# Altium schematic sheet 02_PHY_Automotive.SchDoc (part 2 of 2)
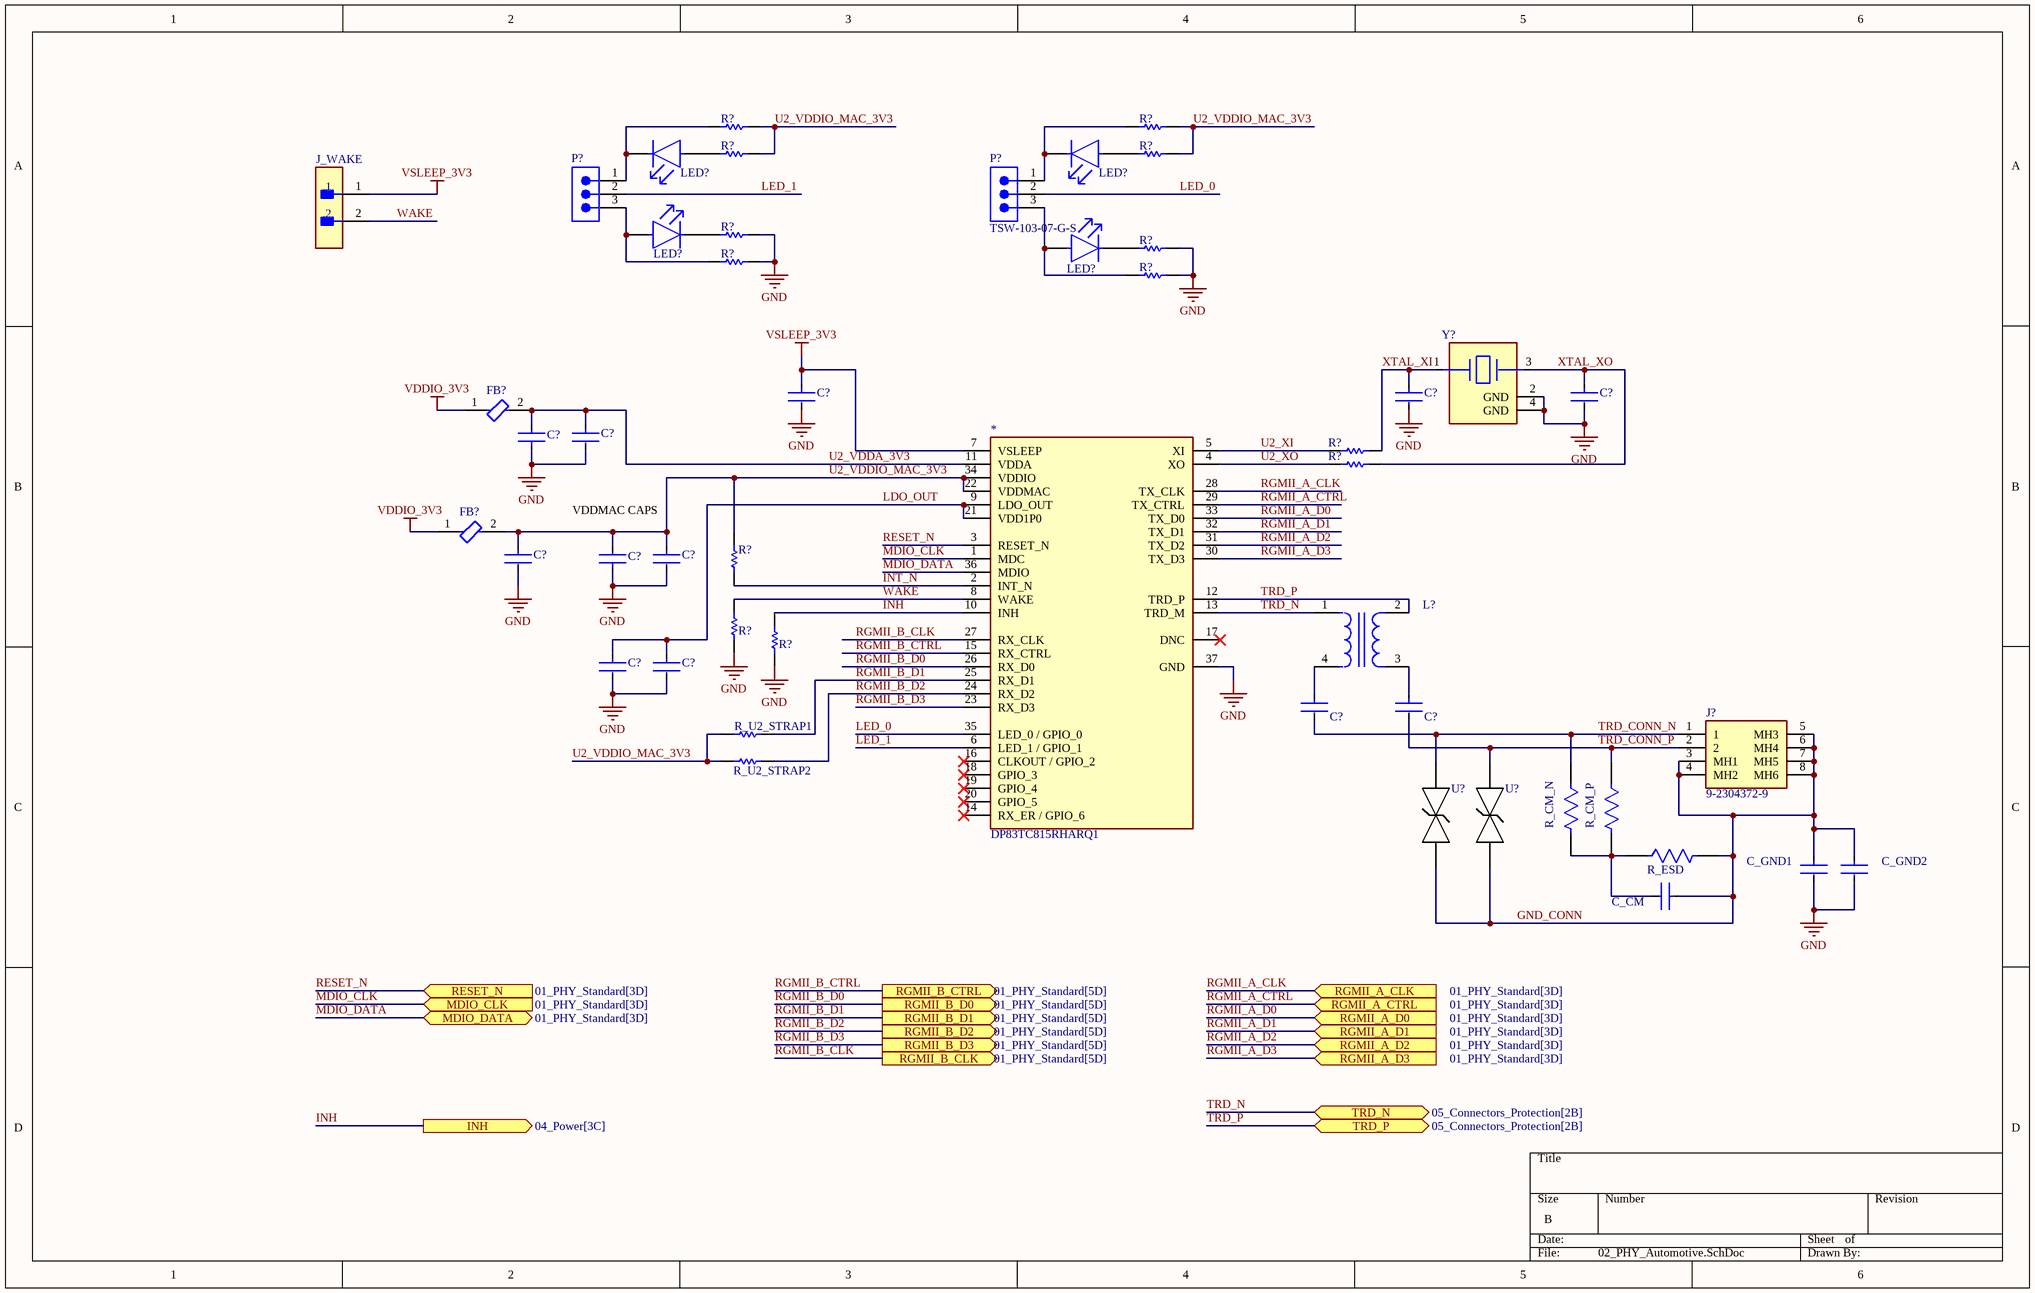
[diagram p1: 02_PHY_Automotive.SchDoc]

## Library data of the parts
* = DP83TC815RHARQ1: Automotive 100Base-T1 Ethernet PHY with RGMII, SGMII and 802.1AS 36-VQFN -40 to 125; Manufacturer: Texas Instruments; Manufacturer Lifecycle Status: ACTIVE; Supplier: Mouser; Supplier Part Number: 595-DP83TC815RHARQ1; Manufacturer Part Number: DP83TC815RHARQ1; RoHS: Compliant; Category: Ethernet Controller; Stock: 627; Pricing: 1=3.97, 10=2.97, 50=2.72, 100=2.45, 1000=2.22, 10000=2.04 (USD); Case/Package: VQFN; Height: 1mm; Interface: RGMII, SGMII; Length: 6mm; Lifecycle Status: Production; Pins: 36; Thickness: 900µm; Width: 6mm; ComponentLink1URL: https://sigma.octopart.com:443/158979647/technical_drawing/Texas-Instruments-DP83TC815RHARQ1.pdf?src-supplier=Texas+Instruments; ComponentLink1Description: https://sigma.octopart.com:443/158979647/technical_drawing/Texas-Instruments-DP83TC815RHARQ1.pdf?src-supplier=Texas+Instruments; ComponentLink2URL: https://octopart.com:443/opatz8j6/c1?t=WeX0H2-6bUulIsG1Jt8hv3i0-DNF6EgtsYe5-0_d1TbLVM-qdl5AsRgmevogmcbsfVOmMxpULns-nvNEE9aIzANogtbU3GBMtZtI8fq6qckBovz9G97i9WrpuxlHuKs9BYn-6D1DANaFcY_qGIZJX9mEtaxsXjueSlrVl1iWUQxH2Bp2NDMtZlTzGpTWBiW7CpwP9V_eJlIy0vZBhrVCBBDA9JUIoAatkLwt8PzT_-9KrI00vijdvUEBTwRYjYCWzSz7DYr9IG1HssyswWTHqsAcyBRv6N7hVVMQZcnxqSqDhzf9RBMys264Gnq-bQZT3orF0xxyRFJYuY-UOMz_xm9QsZyD7JISTUueKHJNrPt3yQi5glmwWHqc71mltjYsTyFmv_ZjbIWrYzA&src-supplier=Texas+Instruments; ComponentLink2Description: https://octopart.com:443/opatz8j6/c1?t=WeX0H2-6bUulIsG1Jt8hv3i0-DNF6EgtsYe5-0_d1TbLVM-qdl5AsRgmevogmcbsfVOmMxpULns-nvNEE9aIzANogtbU3GBMtZtI8fq6qckBovz9G97i9WrpuxlHuKs9BYn-6D1DANaFcY_qGIZJX9mEtaxsXjueSlrVl1iWUQxH2Bp2NDMtZlTzGpTWBiW7CpwP9V_eJlIy0vZBhrVCBBDA9JUIoAatkLwt8PzT_-9KrI00vijdvUEBTwRYjYCWzSz7DYr9IG1HssyswWTHqsAcyBRv6N7hVVMQZcnxqSqDhzf9RBMys264Gnq-bQZT3orF0xxyRFJYuY-UOMz_xm9QsZyD7JISTUueKHJNrPt3yQi5glmwWHqc71mltjYsTyFmv_ZjbIWrYzA&src-supplier=Texas+Instruments; ComponentLink3URL: http://sigma.octopart.com:80/reach_statement/Texas-Instruments-company-64.pdf?src-supplier=Compliance+Statements; ComponentLink3Description: http://sigma.octopart.com:80/reach_statement/Texas-Instruments-company-64.pdf?src-supplier=Compliance+Statements; ComponentLink4URL: http://sigma.octopart.com:80/conflict_mineral_statement/Texas-Instruments-company-63.pdf?src-supplier=Compliance+Statements; ComponentLink4Description: http://sigma.octopart.com:80/conflict_mineral_statement/Texas-Instruments-company-63.pdf?src-supplier=Compliance+Statements
C?#1 C?#10 = CMP-06035-054249-1: Cap Ceramic Multilayer Automotive 0.1uF ±0.1 16VDC X7R 15% 0402 (1005M); Capacitance: 100nF; Tolerance: 10%; Voltage Rating (DC): 16V; Lead Free: Lead Free; Dielectric: X7R
C?#2 C?#3 = CMP-03422-001135-1: Multilayer Ceramic Capacitors Mlcc - Smd/Smt 50V 22Pf C0G 0402 5% Aec-Q200; Manufacturer: Yageo Group; Supplier: Avnet; Supplier Part Number: C0402C220J5GACAUTO; Manufacturer Part Number: C0402C220J5GACAUTO; RoHS: Compliant; Category: Ceramic Capacitors; Stock: 20077; Pricing: 1=0.112, 25=0.046, 100=0.029, 250=0.026, 500=0.023, 1000=0.02, 2500=0.018 (USD); Value: 22pF; Case/Package: 0402; Case Code (Imperial): 0402; Case Code (Metric): 1005; China RoHS: Compliant; Depth: 500µm; Dielectric: C0G; Dielectric Material: Ceramic; Height: 500µm; Lead Free: Lead Free; Length: 1mm; Lifecycle Status: Production; Material: Ceramic; Max Operating Temperature: 125°C; Min Operating Temperature: -55°C; Mounting Technology: Surface Mount; Pins: 2; Number of Terminals: 2; Ratings: AEC-Q200; REACH SVHC: Unaffected; Schedule B: 8532240020, 8532240020|8532240020, 8532240020|8532240020|8532240020, 8532240020|8532240020|8532240020|8532240020; Thickness: 558.8µm; Tolerance: 5%; Voltage Rating: 50V; Voltage Rating (DC): 50V; Width: 500µm; ComponentLink1URL: https://datasheet.octopart.com:443/C0402C220J5GACAUTO-KEMET-datasheet-178087916.pdf?src-supplier=IHS; ComponentLink1Description: https://datasheet.octopart.com:443/C0402C220J5GACAUTO-KEMET-datasheet-178087916.pdf?src-supplier=IHS; ComponentLink2URL: https://datasheet.octopart.com:443/C0402C220J5GACAUTO-KEMET-datasheet-137357759.pdf?src-supplier=Upverter; ComponentLink2Description: https://datasheet.octopart.com:443/C0402C220J5GACAUTO-KEMET-datasheet-137357759.pdf?src-supplier=Upverter; ComponentLink3URL: https://datasheet.octopart.com:443/C0402C220J5GACAUTO-KEMET-datasheet-137357764.pdf?src-supplier=element14+APAC; ComponentLink3Description: https://datasheet.octopart.com:443/C0402C220J5GACAUTO-KEMET-datasheet-137357764.pdf?src-supplier=element14+APAC; ComponentLink4URL: https://datasheet.octopart.com:443/C0402C220J5GACAUTO-KEMET-datasheet-83968781.pdf?src-supplier=element14+APAC; ComponentLink4Description: https://datasheet.octopart.com:443/C0402C220J5GACAUTO-KEMET-datasheet-83968781.pdf?src-supplier=element14+APAC; ComponentLink5URL: https://datasheet.octopart.com:443/C0402C220J5GACAUTO-Kemet-datasheet-66076621.pdf?src-supplier=element14+APAC; ComponentLink5Description: https://datasheet.octopart.com:443/C0402C220J5GACAUTO-Kemet-datasheet-66076621.pdf?src-supplier=element14+APAC; ComponentLink6URL: https://datasheet.octopart.com:443/C0402C220J5GACAUTO-KEMET-datasheet-86448239.pdf?src-supplier=Farnell; ComponentLink6Description: https://datasheet.octopart.com:443/C0402C220J5GACAUTO-KEMET-datasheet-86448239.pdf?src-supplier=Farnell; ComponentLink7URL: https://datasheet.octopart.com:443/C0402C220J5GACAUTO-KEMET-datasheet-100087244.pdf?src-supplier=Farnell; ComponentLink7Description: https://datasheet.octopart.com:443/C0402C220J5GACAUTO-KEMET-datasheet-100087244.pdf?src-supplier=Farnell; ComponentLink8URL: https://datasheet.octopart.com:443/C0402C220J5GACAUTO-KEMET-datasheet-181956123.pdf?src-supplier=Farnell; ComponentLink8Description: https://datasheet.octopart.com:443/C0402C220J5GACAUTO-KEMET-datasheet-181956123.pdf?src-supplier=Farnell; ComponentLink9URL: https://datasheet.octopart.com:443/C0402C220J5GACAUTO-KEMET-datasheet-74831227.pdf?src-supplier=Newark; ComponentLink9Description: https://datasheet.octopart.com:443/C0402C220J5GACAUTO-KEMET-datasheet-74831227.pdf?src-supplier=Newark; ComponentLink10URL: https://datasheet.octopart.com:443/C0402C220J5GACAUTO-Kemet-datasheet-62069308.pdf?src-supplier=Newark; ComponentLink10Description: https://datasheet.octopart.com:443/C0402C220J5GACAUTO-Kemet-datasheet-62069308.pdf?src-supplier=Newark; ComponentLink11URL: https://datasheet.octopart.com:443/C0402C220J5GACAUTO-KEMET-datasheet-176334072.pdf?src-supplier=Newark; ComponentLink11Description: https://datasheet.octopart.com:443/C0402C220J5GACAUTO-KEMET-datasheet-176334072.pdf?src-supplier=Newark; ComponentLink12URL: https://datasheet.octopart.com:443/C0402C220J5GACAUTO-KEMET-datasheet-157246110.pdf?src-supplier=Electro+Sonic; ComponentLink12Description: https://datasheet.octopart.com:443/C0402C220J5GACAUTO-KEMET-datasheet-157246110.pdf?src-supplier=Electro+Sonic; ComponentLink13URL: https://datasheet.octopart.com:443/C0402C220J5GACAUTO-KEMET-datasheet-188512012.pdf?src-supplier=ODG+(Origin+Data+Global); ComponentLink13Description: https://datasheet.octopart.com:443/C0402C220J5GACAUTO-KEMET-datasheet-188512012.pdf?src-supplier=ODG+(Origin+Data+Global); ComponentLink14URL: https://datasheet.octopart.com:443/C0402C220J5GACAUTO-KEMET-datasheet-140803224.pdf?src-supplier=TME; ComponentLink14Description: https://datasheet.octopart.com:443/C0402C220J5GACAUTO-KEMET-datasheet-140803224.pdf?src-supplier=TME; ComponentLink15URL: https://datasheet.octopart.com/C0402C220J5GACAUTO-KEMET-datasheet-84169754.pdf; ComponentLink15Description: https://datasheet.octopart.com/C0402C220J5GACAUTO-KEMET-datasheet-84169754.pdf; ComponentLink16URL: http://sigma.octopart.com:80/conflict_mineral_statement/Yageo-company-3.pdf?src-supplier=Compliance+Statements; ComponentLink16Description: http://sigma.octopart.com:80/conflict_mineral_statement/Yageo-company-3.pdf?src-supplier=Compliance+Statements; ComponentLink17URL: http://sigma.octopart.com:80/rohs_statement/Yageo-company-2.pdf?src-supplier=Compliance+Statements; ComponentLink17Description: http://sigma.octopart.com:80/rohs_statement/Yageo-company-2.pdf?src-supplier=Compliance+Statements
C?#4 C?#6 C?#7 = CMP-03422-001135-1: CAP CER 10000PF 16V X7R 0402; Manufacturer: Yageo; Value: 10 nF; Automotive Grade: Grade 1; Temperature Coefficient: ±15%; Tolerance: 0.1; Material: Ceramic; Octopart: https://octopart.com/ac0402krx7r7bb103-yageo-76900920; Height: 0.55mm; Footprint Url: http://www.yageo.com/exep/pages/download/literatures/UPY-C_GEN_24.pdf; Lead Free: Yes; RoHS: TRUE; Digikey Description: CAP CER 10000PF 16V X7R 0402; Temperature Range Low: -55°C; Device Class L1: Passive Components; Voltage Rating: 16 V; Temperature: -55°C to +125°C; Capacitance: 10 nF; Package: AC0402-0.5; ComponentLink2Description: Datasheet; Device Class L3: Ceramic Capacitors; Temperature Range High: +125°C; Ipc Land Pattern Name: CAPC10050X50; Device Class L2: Capacitors; Temperature Characteristic: X7R; Category: Cap; ComponentLink2URL: http://www.yageo.com/documents/recent/UPY-AC_NP0X7R_16V-to-630V_12.pdf; Manufacturer Part Number: AC0402KRX7R7BB103; Automotive: Yes
C?#5 C?#8 = CMP-03020-024138-1: 16V 470nF X7R ±10% 0603 Multilayer Ceramic Capacitors MLCC - SMD/SMT ROHS; Manufacturer: Yageo Group; Supplier: Mouser; Supplier Part Number: 603-AC0603KRX77BB474; Manufacturer Part Number: AC0603KRX7R7BB474; RoHS: Compliant; Category: Ceramic Capacitors; Stock: 329; Pricing: 1=0.33, 10=0.193, 50=0.136, 100=0.118, 1000=0.089, 10000=0.041 (USD); Value: 470nF; Case/Package: 0603; China RoHS: Compliant; Dielectric: X7R; Dielectric Material: Ceramic; Height: 800µm; Length: 1.6mm; Lifecycle Status: Production; Material: Ceramic; Max Operating Temperature: 125°C; Min Operating Temperature: -55°C; Mounting Technology: Surface Mount; Number of Terminals: 2; Ratings: AEC-Q200; REACH SVHC: Unaffected; Tolerance: 10%; Voltage Rating: 16V; Voltage Rating (DC): 16V; Width: 800µm; ComponentLink1URL: https://datasheet.octopart.com:443/AC0603KRX7R7BB474-Yageo-datasheet-170333968.pdf?src-supplier=IHS; ComponentLink1Description: https://datasheet.octopart.com:443/AC0603KRX7R7BB474-Yageo-datasheet-170333968.pdf?src-supplier=IHS; ComponentLink2URL: https://datasheet.octopart.com:443/AC0603KRX7R7BB474-Yageo-datasheet-130008987.pdf?src-supplier=Upverter; ComponentLink2Description: https://datasheet.octopart.com:443/AC0603KRX7R7BB474-Yageo-datasheet-130008987.pdf?src-supplier=Upverter; ComponentLink3URL: https://datasheet.octopart.com:443/AC0603KRX7R7BB474-Yageo-datasheet-181964733.pdf?src-supplier=Farnell; ComponentLink3Description: https://datasheet.octopart.com:443/AC0603KRX7R7BB474-Yageo-datasheet-181964733.pdf?src-supplier=Farnell; ComponentLink4URL: https://datasheet.octopart.com:443/AC0603KRX7R7BB474-Yageo-Group-datasheet-194252523.pdf?src-supplier=LCSC; ComponentLink4Description: https://datasheet.octopart.com:443/AC0603KRX7R7BB474-Yageo-Group-datasheet-194252523.pdf?src-supplier=LCSC; ComponentLink5URL: https://datasheet.octopart.com:443/AC0603KRX7R7BB474-Yageo-datasheet-164463078.pdf?src-supplier=Future+Electronics; ComponentLink5Description: https://datasheet.octopart.com:443/AC0603KRX7R7BB474-Yageo-datasheet-164463078.pdf?src-supplier=Future+Electronics; ComponentLink6URL: https://datasheet.octopart.com:443/AC0603KRX7R7BB474-Yageo-datasheet-151884373.pdf?src-supplier=Future+Electronics; ComponentLink6Description: https://datasheet.octopart.com:443/AC0603KRX7R7BB474-Yageo-datasheet-151884373.pdf?src-supplier=Future+Electronics; ComponentLink7URL: https://datasheet.octopart.com:443/AC0603KRX7R7BB474-Yageo-datasheet-137699919.pdf?src-supplier=Future+Electronics; ComponentLink7Description: https://datasheet.octopart.com:443/AC0603KRX7R7BB474-Yageo-datasheet-137699919.pdf?src-supplier=Future+Electronics; ComponentLink8URL: http://sigma.octopart.com:80/conflict_mineral_statement/Yageo-company-3.pdf?src-supplier=Compliance+Statements; ComponentLink8Description: http://sigma.octopart.com:80/conflict_mineral_statement/Yageo-company-3.pdf?src-supplier=Compliance+Statements; ComponentLink9URL: http://sigma.octopart.com:80/rohs_statement/Yageo-company-2.pdf?src-supplier=Compliance+Statements; ComponentLink9Description: http://sigma.octopart.com:80/rohs_statement/Yageo-company-2.pdf?src-supplier=Compliance+Statements
C?#9 = CMP-03422-000042-2: AC0805 2.2 uF X7R 10.00% 10 V; Manufacturer: Yageo; Material: Ceramic; Value: 2.2 uF; Automotive Grade: Grade 1; Tolerance: 0.1; Voltage Rating: 10 V; Temperature Coefficient: 15%; Package: AC0805-0.85; Height: 0.95mm; Footprint Url: http://www.yageo.com/exep/pages/download/literatures/UPY-C_GEN_24.pdf; ComponentLink2URL: http://www.yageo.com/documents/recent/UPY-AC_NP0X7R_16V-to-630V_12.pdf; Device Class L1: Passive Components; RoHS: TRUE; Manufacturer Part Number: AC0805KKX7R6BB225; Capacitance: 2.2 uF; Lead Free: Yes; Ipc Land Pattern Name: CAPC200125X85; Temperature Characteristic: X7R; Temperature: -55°C to +125°C; Category: Cap; Temperature Range Low: -55°C; ComponentLink2Description: Datasheet; Device Class L2: Capacitors; Temperature Range High: +125°C; Octopart: https://octopart.com/ac0805kkx7r6bb225-yageo-87214157; Device Class L3: Ceramic Capacitors; Automotive: Yes
C?#11 C?#12 = CMP-03020-024138-1: Ceramic Capacitor, YES, Ceramic, 100V, 20% +Tol, 20% -Tol, X7R, 15% TC, 0.1uF, Surface Mount, 1608M/0603; Manufacturer: Murata; Manufacturer Part Number: GRM188R72A104MA35J; Manufacturer Lifecycle Status: IN PRODUCTION; Value: 100nF; Supplier: Mouser; Supplier Part Number: 81-GRM188R72A104MA5J; RoHS: Compliant; Category: Ceramic Capacitors; Stock: 35906; Pricing: 1=0.16, 10=0.091, 50=0.064, 100=0.056, 1000=0.042, 10000=0.031 (USD); Case/Package: 0603; Country of Origin: Philippines; Dielectric: X7R; Dielectric Material: Ceramic; Export Control Classification Number (ECCN) Code: EAR99; Height: 800µm; Harmonized Tariff Schedule (HTS) Code: 8532.24.00.20; Introduction Date: 2008-08-22; Length: 1.6mm; Lifecycle Status: Production; Material: Ceramic; Max Operating Temperature: 125°C; Min Operating Temperature: -55°C; Mounting Technology: Surface Mount; Number of Terminals: 2; REACH SVHC: Unaffected; Thickness: 800µm; Tolerance: 20%; Voltage Rating: 100V; Voltage Rating (DC): 100V; Width: 800µm; ComponentLink1URL: https://datasheet.octopart.com:443/GRM188R72A104MA35J-Murata-datasheet-165579666.pdf?src-supplier=TME; ComponentLink1Description: https://datasheet.octopart.com:443/GRM188R72A104MA35J-Murata-datasheet-165579666.pdf?src-supplier=TME; ComponentLink2URL: https://datasheet.octopart.com:443/GRM188R72A104MA35J-Murata-datasheet-140705815.pdf?src-supplier=Ciiva; ComponentLink2Description: https://datasheet.octopart.com:443/GRM188R72A104MA35J-Murata-datasheet-140705815.pdf?src-supplier=Ciiva; ComponentLink3URL: https://datasheet.octopart.com:443/GRM188R72A104MA35J-Murata-datasheet-138743343.pdf?src-supplier=Ciiva; ComponentLink3Description: https://datasheet.octopart.com:443/GRM188R72A104MA35J-Murata-datasheet-138743343.pdf?src-supplier=Ciiva; ComponentLink4URL: https://datasheet.octopart.com/GRM188R72A104MA35J-Murata-datasheet-12515295.pdf; ComponentLink4Description: https://datasheet.octopart.com/GRM188R72A104MA35J-Murata-datasheet-12515295.pdf; ComponentLink5URL: https://datasheet.octopart.com/GRM188R72A104MA35J-Murata-datasheet-12510076.pdf; ComponentLink5Description: https://datasheet.octopart.com/GRM188R72A104MA35J-Murata-datasheet-12510076.pdf; ComponentLink6URL: https://datasheet.octopart.com/GRM188R72A104MA35J-Murata-datasheet-11978611.pdf; ComponentLink6Description: https://datasheet.octopart.com/GRM188R72A104MA35J-Murata-datasheet-11978611.pdf; ComponentLink7URL: https://datasheet.octopart.com/GRM188R72A104MA35J-Murata-datasheet-10025737.pdf; ComponentLink7Description: https://datasheet.octopart.com/GRM188R72A104MA35J-Murata-datasheet-10025737.pdf; ComponentLink8URL: https://datasheet.octopart.com/GRM188R72A104MA35J-Murata-datasheet-8819587.pdf; ComponentLink8Description: https://datasheet.octopart.com/GRM188R72A104MA35J-Murata-datasheet-8819587.pdf; ComponentLink9URL: https://datasheet.octopart.com/GRM188R72A104MA35J-Murata-datasheet-38895775.pdf; ComponentLink9Description: https://datasheet.octopart.com/GRM188R72A104MA35J-Murata-datasheet-38895775.pdf; ComponentLink10URL: http://sigma.octopart.com:80/reach_statement/Murata-company-16.pdf?src-supplier=Compliance+Statements; ComponentLink10Description: http://sigma.octopart.com:80/reach_statement/Murata-company-16.pdf?src-supplier=Compliance+Statements
C_CM = CMP-03020-024138-1: CAP CER 4700PF 100V X7R 0603 / 4700 pF ±10% 100V Ceramic Capacitor X7R 0603 (1608 Metric); Manufacturer: Yageo Group; Manufacturer Part Number: C0603C472K1RACAUTO; Value: 4.7nF; Temperature Coefficient: 30ppm/°C; Supplier: Arrow Electronics; Supplier Part Number: C0603C472K1RACAUTO; RoHS: Compliant; Category: Ceramic Capacitors; Stock: 1244000; Pricing: 4000=0.0737, 12000=0.0729 (USD); Case/Package: 0603; China RoHS: Compliant; Country of Origin: Mexico; Depth: 800µm; Dielectric: X7R; Dielectric Material: Ceramic; Export Control Classification Number (ECCN) Code: EAR99; Height: 800µm; Harmonized Tariff Schedule (HTS) Code: 8532.24.00.20; Introduction Date: 2012-06-13; Length: 1.6mm; Lifecycle Status: Production; Material: Ceramic; Max Operating Temperature: 125°C; Min Operating Temperature: -55°C; Mounting Technology: Surface Mount; Number of Terminals: 2; Packaging: Tape and Reel; Radiation Hardening: No; Ratings: AEC-Q200; REACH SVHC: Unaffected; Schedule B: 8532240020, 8532240020|8532240020, 8532240020|8532240020|8532240020, 8532240020|8532240020|8532240020|8532240020; Tolerance: 10%; Voltage Rating: 100V; Voltage Rating (DC): 100V; Width: 800µm; ComponentLink1URL: https://datasheet.octopart.com:443/C0603C472K1RACAUTO-KEMET-datasheet-178087915.pdf?src-supplier=Farnell; ComponentLink1Description: https://datasheet.octopart.com:443/C0603C472K1RACAUTO-KEMET-datasheet-178087915.pdf?src-supplier=Farnell; ComponentLink2URL: https://datasheet.octopart.com:443/C0603C472K1RACAUTO-KEMET-datasheet-138896278.pdf?src-supplier=Farnell; ComponentLink2Description: https://datasheet.octopart.com:443/C0603C472K1RACAUTO-KEMET-datasheet-138896278.pdf?src-supplier=Farnell; ComponentLink3URL: https://datasheet.octopart.com:443/C0603C472K1RACAUTO-KEMET-datasheet-137357764.pdf?src-supplier=Upverter; ComponentLink3Description: https://datasheet.octopart.com:443/C0603C472K1RACAUTO-KEMET-datasheet-137357764.pdf?src-supplier=Upverter; ComponentLink4URL: https://datasheet.octopart.com:443/C0603C472K1RACAUTO-KEMET-datasheet-102159206.pdf?src-supplier=Newark; ComponentLink4Description: https://datasheet.octopart.com:443/C0603C472K1RACAUTO-KEMET-datasheet-102159206.pdf?src-supplier=Newark; ComponentLink5URL: https://datasheet.octopart.com:443/C0603C472K1RACAUTO-KEMET-datasheet-182036809.pdf?src-supplier=Newark; ComponentLink5Description: https://datasheet.octopart.com:443/C0603C472K1RACAUTO-KEMET-datasheet-182036809.pdf?src-supplier=Newark; ComponentLink6URL: https://datasheet.octopart.com:443/C0603C472K1RACAUTO-KEMET-datasheet-182857658.pdf?src-supplier=Newark; ComponentLink6Description: https://datasheet.octopart.com:443/C0603C472K1RACAUTO-KEMET-datasheet-182857658.pdf?src-supplier=Newark; ComponentLink7URL: https://datasheet.octopart.com:443/C0603C472K1RACAUTO-KEMET-datasheet-153410967.pdf?src-supplier=Electro+Sonic; ComponentLink7Description: https://datasheet.octopart.com:443/C0603C472K1RACAUTO-KEMET-datasheet-153410967.pdf?src-supplier=Electro+Sonic; ComponentLink8URL: https://datasheet.octopart.com:443/C0603C472K1RACAUTO-KEMET-datasheet-137357759.pdf?src-supplier=Master+Electronics; ComponentLink8Description: https://datasheet.octopart.com:443/C0603C472K1RACAUTO-KEMET-datasheet-137357759.pdf?src-supplier=Master+Electronics; ComponentLink9URL: https://datasheet.octopart.com/C0603C472K1RACAUTO-KEMET-datasheet-84169754.pdf; ComponentLink9Description: https://datasheet.octopart.com/C0603C472K1RACAUTO-KEMET-datasheet-84169754.pdf; ComponentLink10URL: https://datasheet.octopart.com:443/C0603C472K1RACAUTO-KEMET-datasheet-6397106.pdf?src-supplier=JRH+Electronics; ComponentLink10Description: https://datasheet.octopart.com:443/C0603C472K1RACAUTO-KEMET-datasheet-6397106.pdf?src-supplier=JRH+Electronics
C_GND1 C_GND2 = CMP-08246-000761-1: Cap Ceramic 10nF 1000V X7R 10% Pad SMD 1812 +125°C Automotive T/R; Voltage Rating (DC): 1kV; Width: 0.126inch; Tolerance: 10%; Capacitance: 10nF; Dielectric: X7R; Package Quantity: 1000; Length: 0.177inch; Max Operating Temperature: 125°C; Ratings: AEC-Q200; Lead Free: Lead Free; Voltage Rating: 1kV; Min Operating Temperature: -55°C; Case Code (Imperial): 1812; Case Code (Metric): 4532; Packaging: Tape and Reel; Weight: 0.000952oz; Mount: Surface Mount; Case/Package: 1812; Thickness: 0.087inch; Height: 2mm
FB?#1 FB?#2 = CMP-06046-002774-1: Chip Ferrite Bead, 0603, 600Ω @ 100MHz, 0.15Ω, 25%, 1.3A; DC Resistance (DCR): 150mR; Number of Lines: 1; Impedance: 600R; RoHS Compliant: Yes; Case Code (Imperial): 0603; Package Quantity: 4000; Height: 0.037inch; Case Code (Metric): 1608; Case/Package: 0603; Max Operating Temperature: 125°C; Packaging: Tape and Reel; Max Current Rating: 1.3A; Mount: Surface Mount; Width: 0.032inch; Min Operating Temperature: -55°C; Length: 0.063inch; Number of Circuits: 1; Ratings: AEC-Q200
J? = 9-2304372-9: Connector; Manufacturer_Name: TE Connectivity; Datasheet Link: https://www.te.com/en/product-9-2304372-9.datasheet.pdf; Height: 13.6mm; Manufacturer_Part_Number: 9-2304372-9; Mouser Part Number: 571-9-2304372-9; Mouser Price/Stock: https://www.mouser.co.uk/ProductDetail/TE-Connectivity/9-2304372-9?qs=u4fy%2FsgLU9NYzh9lYmgKGw%3D%3D; Arrow Part Number: 9-2304372-9; Arrow Price/Stock: https://www.arrow.com/en/products/9-2304372-9/te-connectivity
J_WAKE = CMP-02766-000117-1: CONN HEADER VERT 2POS 2.54MM; Max Voltage Rating (AC): 550V; Gender: Male; Max Current Rating: 7.6A; Number of Contacts: 2; Housing Color: Black; Max Operating Temperature: 125°C; Orientation: Straight; Depth: 2.54mm; Pitch: 2.54mm; Housing Material: Polyester; Packaging: Bulk; Termination: Solder; Contact Plating: Gold; Length: 5.08mm; Number of Rows: 1; Radiation Hardening: No; Min Operating Temperature: -55°C; REACH SVHC: No SVHC; Contact Material: Bronze
L? = CMP-08256-000003-1: CMC 200UH 70MA 2LN SMD; Manufacturer: TDK; Test Frequency: 100kHz; Series Resistance: 5.5Ω; Impedance At Frequency: 9.5kΩ @ 10MHz; Tolerance: -10/30%; Automotive Grade: Grade 1; Automotive: Yes; ComponentLink2URL: https://product.tdk.com/info/en/catalog/datasheets/cmf_automotive_signal_act1210l-201_en.pdf; Height: 2.5mm; RoHS: TRUE; Rms Current: 70mA; Temperature Range High: +125°C; Composition: Wirewound; Device Class L1: Passive Components; Device Class L3: Common Mode Chokes; Value: 200uH; Category: Ind; Mouser Description: Ind Common Mode Choke 200uH 9.5KOhm 70mA 5.5Ohm -10% to 30% Wirewound 4-Pin 1210; Device Class L2: EMI / RFI Components; Temperature Range Low: -40°C; Package: ACT1210L; Digikey Description: CMC 200UH 70MA 2LN SMD; Octopart: https://octopart.com/act1210l-201-2p-tl00-tdk-81014617; Manufacturer Part Number: ACT1210L-201-2P-TL00; Lead Free: Yes; Inductance: 200uH; Temperature: -40°C to +125°C; ComponentLink2Description: Datasheet
LED?#1-LED?#4 = CMP-08952-000001-1: LED GREEN 1608 SMD; Manufacturer: Rohm; Forward Current: 20mA; Luminous Intensity: 6.3mcd; Wavelength: 560nm; Automotive Grade: Grade 3; Reverse Voltage: 5V; Forward Voltage: 2.2V; Power Dissipation: 54mW; Led Orientation: Top View; Temperature Range Low: -40°C; Automotive: Yes; Height: 0.65mm; Manufacturer Part Number: SML-D12P8WT86C; Device Class L3: unset; Octopart: https://octopart.com/sml-d12p8wt86c-rohm-77740213; Lead Free: Yes; Digikey Description: LED GREEN 1608 SMD; Temperature Range High: +85°C; ComponentLink2URL: https://www.rohm.com/datasheet/SML-D12P8W(C)/sml-d12x8(c)-e; ComponentLink2Description: Datasheet; RoHS: TRUE; Device Class L2: LEDs; Package: SML-D12; Category: Diode; Temperature: -40°C to +85°C; Mouser Description: LED Uni-Color Green Automotive 2-Pin Chip 0603(1608Metric) T/R; Colour: Green; Device Class L1: Optoelectronics
P?#1 P?#2 = CMP-1024-00333-1: 0.025" SQ Post Header, Through-hole, Vertical, -55 to 125 degC, 2.54 mm Pitch, 3-Pin, Male, RoHS; Manufacturer: Samtec; Pitch: 2.54 mm; ComponentLink3URL: http://www.samtec.com/documents/webfiles/cpdf/TSW-XXX-XX-XXX-X-XX-XXX-MKT.pdf; Temperature Range: -55 to 125 degC; DatasheetVersion: F-214; ComponentLink1Description: Manufacturer URL; ComponentLink2URL: http://www.samtec.com/documents/webfiles/pdf/TSW_TH.PDF; RoHS: True; Orientation: Vertical; ComponentLink2Description: Datasheet; ComponentLink3Description: Package Specification; PackageDescription: .025[0.64] SQ. Post Terminal Strip Assembly; Mounting Technology: Through-hole; PackageVersion: DM, 8/1988; ComponentLink1URL: http://www.samtec.com; PackageReference: TSW-103-07-X-S; PartNumber: TSW-103-07-G-S
R?#1 R?#2 R?#7 R?#8 R_U2_STRAP1 R_U2_STRAP2 = CMP-2002-07181-1: Res Thick Film 0402 2.49K Ohm 1% 0.063W(1/16W) ±100ppm/C Pad SMD Automotive T/R; Manufacturer: Yageo Group; Max Power Dissipation: 63mW; Power Rating: 62.5mW; Value: 2.49kΩ; Temperature Coefficient: 100ppm/°C; Voltage Rating: 50V; Supplier: Mouser; Supplier Part Number: 603-AC0402FR-072K49L; Manufacturer Part Number: AC0402FR-072K49L; RoHS: Compliant; Category: Chip SMD Resistors; Stock: 227098; Pricing: 1=0.1, 10=0.013, 50=0.013, 100=0.008, 1000=0.007, 10000=0.003 (USD); Case/Package: 0402; Case Code (Imperial): 0402; Case Code (Metric): 1005; China RoHS: Non-Compliant; Composition: Thick Film; Country of Origin: Mainland China, Taiwan; Export Control Classification Number (ECCN) Code: EAR99; Features: Automotive AEC-Q200, Moisture Resistant; Height: 320µm; Harmonized Tariff Schedule (HTS) Code: 8533.21.00.30; Introduction Date: 2012-04-10; Length: 1mm; Lifecycle Status: Production; Max Operating Temperature: 155°C; Min Operating Temperature: -55°C; Mounting Technology: Surface Mount; Number of Terminals: 2; Number of Terminations: 2; Packaging: Tape & Reel; Ratings: AEC-Q200; REACH SVHC: Unaffected; Schedule B: 8533210045, 8533210045|8533210045|8533210045|8533210045|8533210045; Termination: SMD/SMT; Tolerance: 1%; Weight: 652.039032µg; Width: 500µm; Working Voltage: 50V; ComponentLink1URL: https://datasheet.octopart.com:443/AC0402FR-072K49L-Yageo-datasheet-182189377.pdf?src-supplier=IHS; ComponentLink1Description: https://datasheet.octopart.com:443/AC0402FR-072K49L-Yageo-datasheet-182189377.pdf?src-supplier=IHS; ComponentLink2URL: https://datasheet.octopart.com:443/AC0402FR-072K49L-Yageo-datasheet-83209224.pdf?src-supplier=Upverter; ComponentLink2Description: https://datasheet.octopart.com:443/AC0402FR-072K49L-Yageo-datasheet-83209224.pdf?src-supplier=Upverter; ComponentLink3URL: https://datasheet.octopart.com:443/AC0402FR-072K49L-Yageo-datasheet-178509465.pdf?src-supplier=Newark; ComponentLink3Description: https://datasheet.octopart.com:443/AC0402FR-072K49L-Yageo-datasheet-178509465.pdf?src-supplier=Newark; ComponentLink4URL: https://datasheet.octopart.com:443/AC0402FR-072K49L-Yageo-Group-datasheet-189830439.pdf?src-supplier=Future+Electronics; ComponentLink4Description: https://datasheet.octopart.com:443/AC0402FR-072K49L-Yageo-Group-datasheet-189830439.pdf?src-supplier=Future+Electronics; ComponentLink5URL: https://datasheet.octopart.com:443/AC0402FR-072K49L-Yageo-datasheet-166720450.pdf?src-supplier=Future+Electronics; ComponentLink5Description: https://datasheet.octopart.com:443/AC0402FR-072K49L-Yageo-datasheet-166720450.pdf?src-supplier=Future+Electronics; ComponentLink6URL: https://datasheet.octopart.com:443/AC0402FR-072K49L-Yageo-datasheet-151884373.pdf?src-supplier=Future+Electronics; ComponentLink6Description: https://datasheet.octopart.com:443/AC0402FR-072K49L-Yageo-datasheet-151884373.pdf?src-supplier=Future+Electronics; ComponentLink7URL: https://datasheet.octopart.com:443/AC0402FR-072K49L-Yageo-datasheet-137699919.pdf?src-supplier=Future+Electronics; ComponentLink7Description: https://datasheet.octopart.com:443/AC0402FR-072K49L-Yageo-datasheet-137699919.pdf?src-supplier=Future+Electronics; ComponentLink8URL: https://datasheet.octopart.com:443/AC0402FR-072K49L-Yageo-Group-datasheet-188689268.pdf?src-supplier=LCSC; ComponentLink8Description: https://datasheet.octopart.com:443/AC0402FR-072K49L-Yageo-Group-datasheet-188689268.pdf?src-supplier=LCSC; ComponentLink9URL: https://datasheet.octopart.com:443/AC0402FR-072K49L-Yageo-Group-datasheet-164768995.pdf?src-supplier=ODG+(Origin+Data+Global); ComponentLink9Description: https://datasheet.octopart.com:443/AC0402FR-072K49L-Yageo-Group-datasheet-164768995.pdf?src-supplier=ODG+(Origin+Data+Global); ComponentLink10URL: https://datasheet.octopart.com/AC0402FR-072K49L-Yageo-datasheet-12512238.pdf; ComponentLink10Description: https://datasheet.octopart.com/AC0402FR-072K49L-Yageo-datasheet-12512238.pdf; ComponentLink11URL: http://sigma.octopart.com:80/conflict_mineral_statement/Yageo-company-3.pdf?src-supplier=Compliance+Statements; ComponentLink11Description: http://sigma.octopart.com:80/conflict_mineral_statement/Yageo-company-3.pdf?src-supplier=Compliance+Statements; ComponentLink12URL: http://sigma.octopart.com:80/rohs_statement/Yageo-company-2.pdf?src-supplier=Compliance+Statements; ComponentLink12Description: http://sigma.octopart.com:80/rohs_statement/Yageo-company-2.pdf?src-supplier=Compliance+Statements
R?#3-R?#6 = CMP-2002-07181-1: Res Thick Film 0402 560 Ohm 5% 0.063W(1/16W) ±100ppm/C Pad SMD Automotive T/R; Manufacturer: Yageo Group; Manufacturer Part Number: AC0402JR-07560RL; Max Power Dissipation: 63mW; Power Rating: 62.5mW; Value: 560Ω; Temperature Coefficient: 100ppm/°C; Voltage Rating: 50V; Supplier: Avnet; Supplier Part Number: AC0402JR-07560RL; RoHS: Compliant; Category: Chip SMD Resistors; Stock: 210000; Pricing: 10000=0.0007 (USD); Case/Package: 0402; Case Code (Imperial): 0402; Case Code (Metric): 1005; China RoHS: Non-Compliant; Composition: Thick Film; Country of Origin: Mainland China, Taiwan; Export Control Classification Number (ECCN) Code: EAR99; Features: Automotive AEC-Q200, Moisture Resistant; Height: 320µm; Harmonized Tariff Schedule (HTS) Code: 8533.21.00.30; Introduction Date: 2012-04-10; Length: 1mm; Lifecycle Status: Production; Max Operating Temperature: 155°C; Min Operating Temperature: -55°C; Mounting Technology: Surface Mount; Number of Terminals: 2; Number of Terminations: 2; Packaging: Tape & Reel; Ratings: AEC-Q200; REACH SVHC: Unaffected; Termination: SMD/SMT; Tolerance: 5%; Weight: 652.039032µg; Width: 500µm; Working Voltage: 50V; ComponentLink1URL: https://datasheet.octopart.com:443/AC0402JR-07560RL-Yageo-datasheet-182189377.pdf?src-supplier=IHS; ComponentLink1Description: https://datasheet.octopart.com:443/AC0402JR-07560RL-Yageo-datasheet-182189377.pdf?src-supplier=IHS; ComponentLink2URL: https://datasheet.octopart.com:443/AC0402JR-07560RL-Yageo-datasheet-83209224.pdf?src-supplier=Upverter; ComponentLink2Description: https://datasheet.octopart.com:443/AC0402JR-07560RL-Yageo-datasheet-83209224.pdf?src-supplier=Upverter; ComponentLink3URL: https://datasheet.octopart.com:443/AC0402JR-07560RL-Yageo-datasheet-178509465.pdf?src-supplier=Newark; ComponentLink3Description: https://datasheet.octopart.com:443/AC0402JR-07560RL-Yageo-datasheet-178509465.pdf?src-supplier=Newark; ComponentLink4URL: https://datasheet.octopart.com:443/AC0402JR-07560RL-Yageo-datasheet-166720450.pdf?src-supplier=JRH+Electronics; ComponentLink4Description: https://datasheet.octopart.com:443/AC0402JR-07560RL-Yageo-datasheet-166720450.pdf?src-supplier=JRH+Electronics; ComponentLink5URL: https://datasheet.octopart.com:443/AC0402JR-07560RL-Yageo-Group-datasheet-188689268.pdf?src-supplier=LCSC; ComponentLink5Description: https://datasheet.octopart.com:443/AC0402JR-07560RL-Yageo-Group-datasheet-188689268.pdf?src-supplier=LCSC; ComponentLink6URL: https://datasheet.octopart.com:443/AC0402JR-07560RL-Yageo-Group-datasheet-164768995.pdf?src-supplier=ODG+(Origin+Data+Global); ComponentLink6Description: https://datasheet.octopart.com:443/AC0402JR-07560RL-Yageo-Group-datasheet-164768995.pdf?src-supplier=ODG+(Origin+Data+Global); ComponentLink7URL: https://datasheet.octopart.com:443/AC0402JR-07560RL-Yageo-datasheet-151884373.pdf?src-supplier=Future+Electronics; ComponentLink7Description: https://datasheet.octopart.com:443/AC0402JR-07560RL-Yageo-datasheet-151884373.pdf?src-supplier=Future+Electronics; ComponentLink8URL: https://datasheet.octopart.com:443/AC0402JR-07560RL-Yageo-datasheet-137699919.pdf?src-supplier=Future+Electronics; ComponentLink8Description: https://datasheet.octopart.com:443/AC0402JR-07560RL-Yageo-datasheet-137699919.pdf?src-supplier=Future+Electronics; ComponentLink9URL: https://datasheet.octopart.com/AC0402JR-07560RL-Yageo-datasheet-12512238.pdf; ComponentLink9Description: https://datasheet.octopart.com/AC0402JR-07560RL-Yageo-datasheet-12512238.pdf; ComponentLink10URL: http://sigma.octopart.com:80/conflict_mineral_statement/Yageo-company-3.pdf?src-supplier=Compliance+Statements; ComponentLink10Description: http://sigma.octopart.com:80/conflict_mineral_statement/Yageo-company-3.pdf?src-supplier=Compliance+Statements; ComponentLink11URL: http://sigma.octopart.com:80/rohs_statement/Yageo-company-2.pdf?src-supplier=Compliance+Statements; ComponentLink11Description: http://sigma.octopart.com:80/rohs_statement/Yageo-company-2.pdf?src-supplier=Compliance+Statements
R?#9 R?#10 = CMP-2002-07181-1: Res Thick Film 0402 100 Ohm 5% 0.063W(1/16W) ±100ppm/C Pad SMD T/R Automotive AEC-Q200; Manufacturer: Yageo Group; Power Rating: 62.5mW; Value: 100Ω; Temperature Coefficient: 100ppm/°C; Voltage Rating: 50V; Supplier: Future Electronics; Supplier Part Number: AC0402JR-13100RL; Manufacturer Part Number: AC0402JR-13100RL; RoHS: Compliant; Category: Chip SMD Resistors; Stock: 50000; Pricing: 50000=0.0054, 100000=0.0052, 150000=0.0052, 200000=0.0051, 250000=0.005 (USD); Case/Package: 0402; China RoHS: Non-Compliant; Composition: Thick Film; Country of Origin: Mainland China, Taiwan; Export Control Classification Number (ECCN) Code: EAR99; Height: 320µm; Harmonized Tariff Schedule (HTS) Code: 8533.21.00.30; Introduction Date: 2012-04-10; Length: 1mm; Lifecycle Status: Production; Max Operating Temperature: 155°C; Min Operating Temperature: -55°C; Mounting Technology: Surface Mount; Number of Terminals: 2; Packaging: Tape & Reel; Ratings: AEC-Q200; REACH SVHC: Unaffected; Tolerance: 5%; Width: 500µm; Working Voltage: 50V; ComponentLink1URL: https://datasheet.octopart.com:443/AC0402JR-13100RL-Yageo-datasheet-182189377.pdf?src-supplier=IHS; ComponentLink1Description: https://datasheet.octopart.com:443/AC0402JR-13100RL-Yageo-datasheet-182189377.pdf?src-supplier=IHS; ComponentLink2URL: https://datasheet.octopart.com:443/AC0402JR-13100RL-Yageo-datasheet-83209224.pdf?src-supplier=Upverter; ComponentLink2Description: https://datasheet.octopart.com:443/AC0402JR-13100RL-Yageo-datasheet-83209224.pdf?src-supplier=Upverter; ComponentLink3URL: https://datasheet.octopart.com/AC0402JR-13100RL-Yageo-datasheet-12512238.pdf; ComponentLink3Description: https://datasheet.octopart.com/AC0402JR-13100RL-Yageo-datasheet-12512238.pdf; ComponentLink4URL: http://sigma.octopart.com:80/conflict_mineral_statement/Yageo-company-3.pdf?src-supplier=Compliance+Statements; ComponentLink4Description: http://sigma.octopart.com:80/conflict_mineral_statement/Yageo-company-3.pdf?src-supplier=Compliance+Statements; ComponentLink5URL: http://sigma.octopart.com:80/rohs_statement/Yageo-company-2.pdf?src-supplier=Compliance+Statements; ComponentLink5Description: http://sigma.octopart.com:80/rohs_statement/Yageo-company-2.pdf?src-supplier=Compliance+Statements
R?#11 = CMP-2002-07181-1: Res Thick Film 0402 2.2K Ohm 1% 0.063W(1/16W) ±100ppm/C Molded SMD Automotive Paper T/R; Manufacturer: Vishay; Max Power Dissipation: 63mW; Value: 2.2kΩ; Temperature Coefficient: 100ppm/°C; Voltage Rating: 50V; Supplier: Avnet; Supplier Part Number: CRCW04022K20FKTD; Manufacturer Part Number: CRCW04022K20FKTD; Category: Chip SMD Resistors; Stock: 10000; Pricing: 10000=0.00956 (USD); Case/Package: 0402; Case Code (Imperial): 0402; China RoHS: Non-Compliant; Composition: Thick Film; Country of Origin: Israel; Depth: 500µm; Export Control Classification Number (ECCN) Code: EAR99; Features: Automotive AEC-Q200; Height: 350µm; Harmonized Tariff Schedule (HTS) Code: 8533.21.00.30; Introduction Date: 2005-09-28; Lead Free: Contains Lead; Length: 1mm; Lifecycle Status: Production; Max Operating Temperature: 155°C; Military Standard: Not; Min Operating Temperature: -55°C; Mounting Technology: Surface Mount; Number of Terminals: 2; Number of Terminations: 2; Packaging: Tape & Reel (TR); Power Rating: 63mW; Ratings: AEC-Q200; REACH SVHC: Affected; RoHS: Non-Compliant; Tolerance: 1%; Voltage Rating (DC): 50V; Weight: 652.039032µg; Width: 500µm; Working Voltage: 50V; ComponentLink1URL: https://datasheet.octopart.com:443/CRCW04022K20FKTD-Vishay-datasheet-175863636.pdf?src-supplier=IHS; ComponentLink1Description: https://datasheet.octopart.com:443/CRCW04022K20FKTD-Vishay-datasheet-175863636.pdf?src-supplier=IHS; ComponentLink2URL: https://datasheet.octopart.com:443/CRCW04022K20FKTD-Vishay-datasheet-182027442.pdf?src-supplier=IHS; ComponentLink2Description: https://datasheet.octopart.com:443/CRCW04022K20FKTD-Vishay-datasheet-182027442.pdf?src-supplier=IHS; ComponentLink3URL: https://datasheet.octopart.com/D-CRCW-Lead-%28Pb%29-Bearing-Thick-Film%2C-Rectangular-Chip-Resistors-Vishay-datasheet-family-72.pdf; ComponentLink3Description: https://datasheet.octopart.com/D-CRCW-Lead-%28Pb%29-Bearing-Thick-Film%2C-Rectangular-Chip-Resistors-Vishay-datasheet-family-72.pdf; ComponentLink4URL: https://datasheet.octopart.com/CRCW04022K20FKTD-Vishay-datasheet-13242068.pdf; ComponentLink4Description: https://datasheet.octopart.com/CRCW04022K20FKTD-Vishay-datasheet-13242068.pdf; ComponentLink5URL: https://datasheet.octopart.com/CRCW04022K20FKTD-Vishay-datasheet-13195083.pdf; ComponentLink5Description: https://datasheet.octopart.com/CRCW04022K20FKTD-Vishay-datasheet-13195083.pdf; ComponentLink6URL: https://datasheet.octopart.com/CRCW04022K20FKTD-Vishay-datasheet-13034211.pdf; ComponentLink6Description: https://datasheet.octopart.com/CRCW04022K20FKTD-Vishay-datasheet-13034211.pdf; ComponentLink7URL: https://datasheet.octopart.com/CRCW04022K20FKTD-Vishay-datasheet-12600034.pdf; ComponentLink7Description: https://datasheet.octopart.com/CRCW04022K20FKTD-Vishay-datasheet-12600034.pdf; ComponentLink8URL: https://datasheet.octopart.com/CRCW04022K20FKTD-Vishay-datasheet-12532161.pdf; ComponentLink8Description: https://datasheet.octopart.com/CRCW04022K20FKTD-Vishay-datasheet-12532161.pdf; ComponentLink9URL: https://datasheet.octopart.com/CRCW04022K20FKTD-Vishay-datasheet-12517896.pdf; ComponentLink9Description: https://datasheet.octopart.com/CRCW04022K20FKTD-Vishay-datasheet-12517896.pdf; ComponentLink10URL: https://datasheet.octopart.com/CRCW04022K20FKTD-Vishay-datasheet-12509762.pdf; ComponentLink10Description: https://datasheet.octopart.com/CRCW04022K20FKTD-Vishay-datasheet-12509762.pdf; ComponentLink11URL: https://datasheet.octopart.com/CRCW04022K20FKTD-Vishay-datasheet-10322335.pdf; ComponentLink11Description: https://datasheet.octopart.com/CRCW04022K20FKTD-Vishay-datasheet-10322335.pdf; ComponentLink12URL: https://datasheet.octopart.com/CRCW04022K20FKTD-Vishay-datasheet-8788789.pdf; ComponentLink12Description: https://datasheet.octopart.com/CRCW04022K20FKTD-Vishay-datasheet-8788789.pdf; ComponentLink13URL: https://datasheet.octopart.com/CRCW04022K20FKTD-Vishay-datasheet-8361388.pdf; ComponentLink13Description: https://datasheet.octopart.com/CRCW04022K20FKTD-Vishay-datasheet-8361388.pdf; ComponentLink14URL: https://datasheet.octopart.com/CRCW04022K20FKTD-Vishay-datasheet-5306405.pdf; ComponentLink14Description: https://datasheet.octopart.com/CRCW04022K20FKTD-Vishay-datasheet-5306405.pdf; ComponentLink15URL: https://datasheet.octopart.com/CRCW04022K20FKTD-Vishay-datasheet-546287.pdf; ComponentLink15Description: https://datasheet.octopart.com/CRCW04022K20FKTD-Vishay-datasheet-546287.pdf; ComponentLink16URL: http://sigma.octopart.com:80/rohs_statement/Vishay-company-15.pdf?src-supplier=Compliance+Statements; ComponentLink16Description: http://sigma.octopart.com:80/rohs_statement/Vishay-company-15.pdf?src-supplier=Compliance+Statements
R?#12 R?#13 = CMP-2002-07181-1: Res Thick Film 0402 10K Ohm 5% 0.063W(1/16W) ±100ppm/C Pad SMD T/R Automotive AEC-Q200; Manufacturer: Yageo Group; Power Rating: 62.5mW; Value: 10kΩ; Temperature Coefficient: 100ppm/°C; Voltage Rating: 50V; Supplier: Future Electronics; Supplier Part Number: AC0402JR-1310KL; Manufacturer Part Number: AC0402JR-1310KL; RoHS: Compliant; Category: Chip SMD Resistors; Stock: 500000; Pricing: 50000=0.0045, 100000=0.0044, 150000=0.0043, 200000=0.0043, 250000=0.0042 (USD); Case/Package: 0402; China RoHS: Non-Compliant; Composition: Thick Film; Country of Origin: Mainland China, Taiwan; Export Control Classification Number (ECCN) Code: EAR99; Height: 320µm; Harmonized Tariff Schedule (HTS) Code: 8533.21.00.30; Introduction Date: 2012-04-10; Length: 1mm; Lifecycle Status: Production; Max Operating Temperature: 155°C; Min Operating Temperature: -55°C; Mounting Technology: Surface Mount; Number of Terminals: 2; Packaging: Tape & Reel; Ratings: AEC-Q200; REACH SVHC: Unaffected; Tolerance: 5%; Width: 500µm; Working Voltage: 50V; ComponentLink1URL: https://datasheet.octopart.com:443/AC0402JR-1310KL-Yageo-datasheet-182189377.pdf?src-supplier=IHS; ComponentLink1Description: https://datasheet.octopart.com:443/AC0402JR-1310KL-Yageo-datasheet-182189377.pdf?src-supplier=IHS; ComponentLink2URL: https://datasheet.octopart.com:443/AC0402JR-1310KL-Yageo-datasheet-83209224.pdf?src-supplier=Upverter; ComponentLink2Description: https://datasheet.octopart.com:443/AC0402JR-1310KL-Yageo-datasheet-83209224.pdf?src-supplier=Upverter; ComponentLink3URL: https://datasheet.octopart.com:443/AC0402JR-1310KL-Yageo-datasheet-178509465.pdf?src-supplier=Newark; ComponentLink3Description: https://datasheet.octopart.com:443/AC0402JR-1310KL-Yageo-datasheet-178509465.pdf?src-supplier=Newark; ComponentLink4URL: https://datasheet.octopart.com:443/AC0402JR-1310KL-Yageo-datasheet-166720450.pdf?src-supplier=Future+Electronics; ComponentLink4Description: https://datasheet.octopart.com:443/AC0402JR-1310KL-Yageo-datasheet-166720450.pdf?src-supplier=Future+Electronics; ComponentLink5URL: https://datasheet.octopart.com:443/AC0402JR-1310KL-Yageo-datasheet-151884373.pdf?src-supplier=Future+Electronics; ComponentLink5Description: https://datasheet.octopart.com:443/AC0402JR-1310KL-Yageo-datasheet-151884373.pdf?src-supplier=Future+Electronics; ComponentLink6URL: https://datasheet.octopart.com:443/AC0402JR-1310KL-Yageo-datasheet-137699919.pdf?src-supplier=Future+Electronics; ComponentLink6Description: https://datasheet.octopart.com:443/AC0402JR-1310KL-Yageo-datasheet-137699919.pdf?src-supplier=Future+Electronics; ComponentLink7URL: https://datasheet.octopart.com/AC0402JR-1310KL-Yageo-datasheet-12512238.pdf; ComponentLink7Description: https://datasheet.octopart.com/AC0402JR-1310KL-Yageo-datasheet-12512238.pdf; ComponentLink8URL: http://sigma.octopart.com:80/conflict_mineral_statement/Yageo-company-3.pdf?src-supplier=Compliance+Statements; ComponentLink8Description: http://sigma.octopart.com:80/conflict_mineral_statement/Yageo-company-3.pdf?src-supplier=Compliance+Statements; ComponentLink9URL: http://sigma.octopart.com:80/rohs_statement/Yageo-company-2.pdf?src-supplier=Compliance+Statements; ComponentLink9Description: http://sigma.octopart.com:80/rohs_statement/Yageo-company-2.pdf?src-supplier=Compliance+Statements
R_CM_N R_CM_P = CMP-04015-084229-1: 1kΩ ±1% 0.75W Chip Resistor 2010 Thick Film AEC-Q200 Qualified; RoHS Compliant: Yes
R_ESD = CMP-03412-037405-1: Manufacturer: Yageo; Resistance: 100KΩ; Power Rating: 1/8W; Voltage Rating: 150V; Automotive Grade: Grade 0; Value: 100KΩ; Tolerance: 0.01; Series: AC; Ipc Land Pattern Name: RESC200125X50; Octopart: https://octopart.com/ac0805fr-13100kl-yageo-25938707; Device Class L2: Resistors; Lead Free: Yes; Footprint Url: http://www.yageo.com/exep/pages/download/literatures/PYu-R_Mount_10.pdf; Category: Res; Composition: Thick Film; Mouser Description: Chip Resistor Automotive Grade Thick Film 0805 100kOhm 1% Paper T/R; RoHS: TRUE; Height: 0.6mm; Package: AC0805; Temperature Range Low: -55°C; Manufacturer Part Number: AC0805FR-13100KL; Device Class L1: Passive Components; ComponentLink2URL: http://www.yageo.com/documents/recent/PYu-AC_51_RoHS_L_6.pdf; Automotive: Yes; ComponentLink2Description: Datasheet; Device Class L3: Chip SMD Resistors; Temperature: -55°C to +155°C; Temperature Range High: +155°C
U?#1 U?#2 = TPD1E01B04DPYRQ1: Automotive 0.2pF Â±3.6V ESD protection diode in 0402 package for high-speed interfaces 2-X1SON -40 to 125; Manufacturer_Name: Texas Instruments; TYPE: TYPE; RefDes: RefDes; Copyright: Copyright (C) 2025 Ultra Librarian. All rights reserved.; Manufacturer_Part_Number: TPD1E01B04DPYRQ1
Y? = CMP-36405-000019-1: CRYSTAL 25.0000MHZ 18PF SMD; ESR (Equivalent Series Resistance): 40R; Frequency Stability: 10ppm; Frequency: 25MHz; Max Operating Temperature: 85°C; Length: 3.2mm; Packaging: Tape and Reel; Min Operating Temperature: -20°C; Depth: 2.5mm; Case/Package: SMD/SMT; Load Capacitance: 18pF; Number of Pins: 4